# EAGLE design LoloTone - EuroRack - Power Supply Lunch Box V3 (EAGLE 7.1.0)
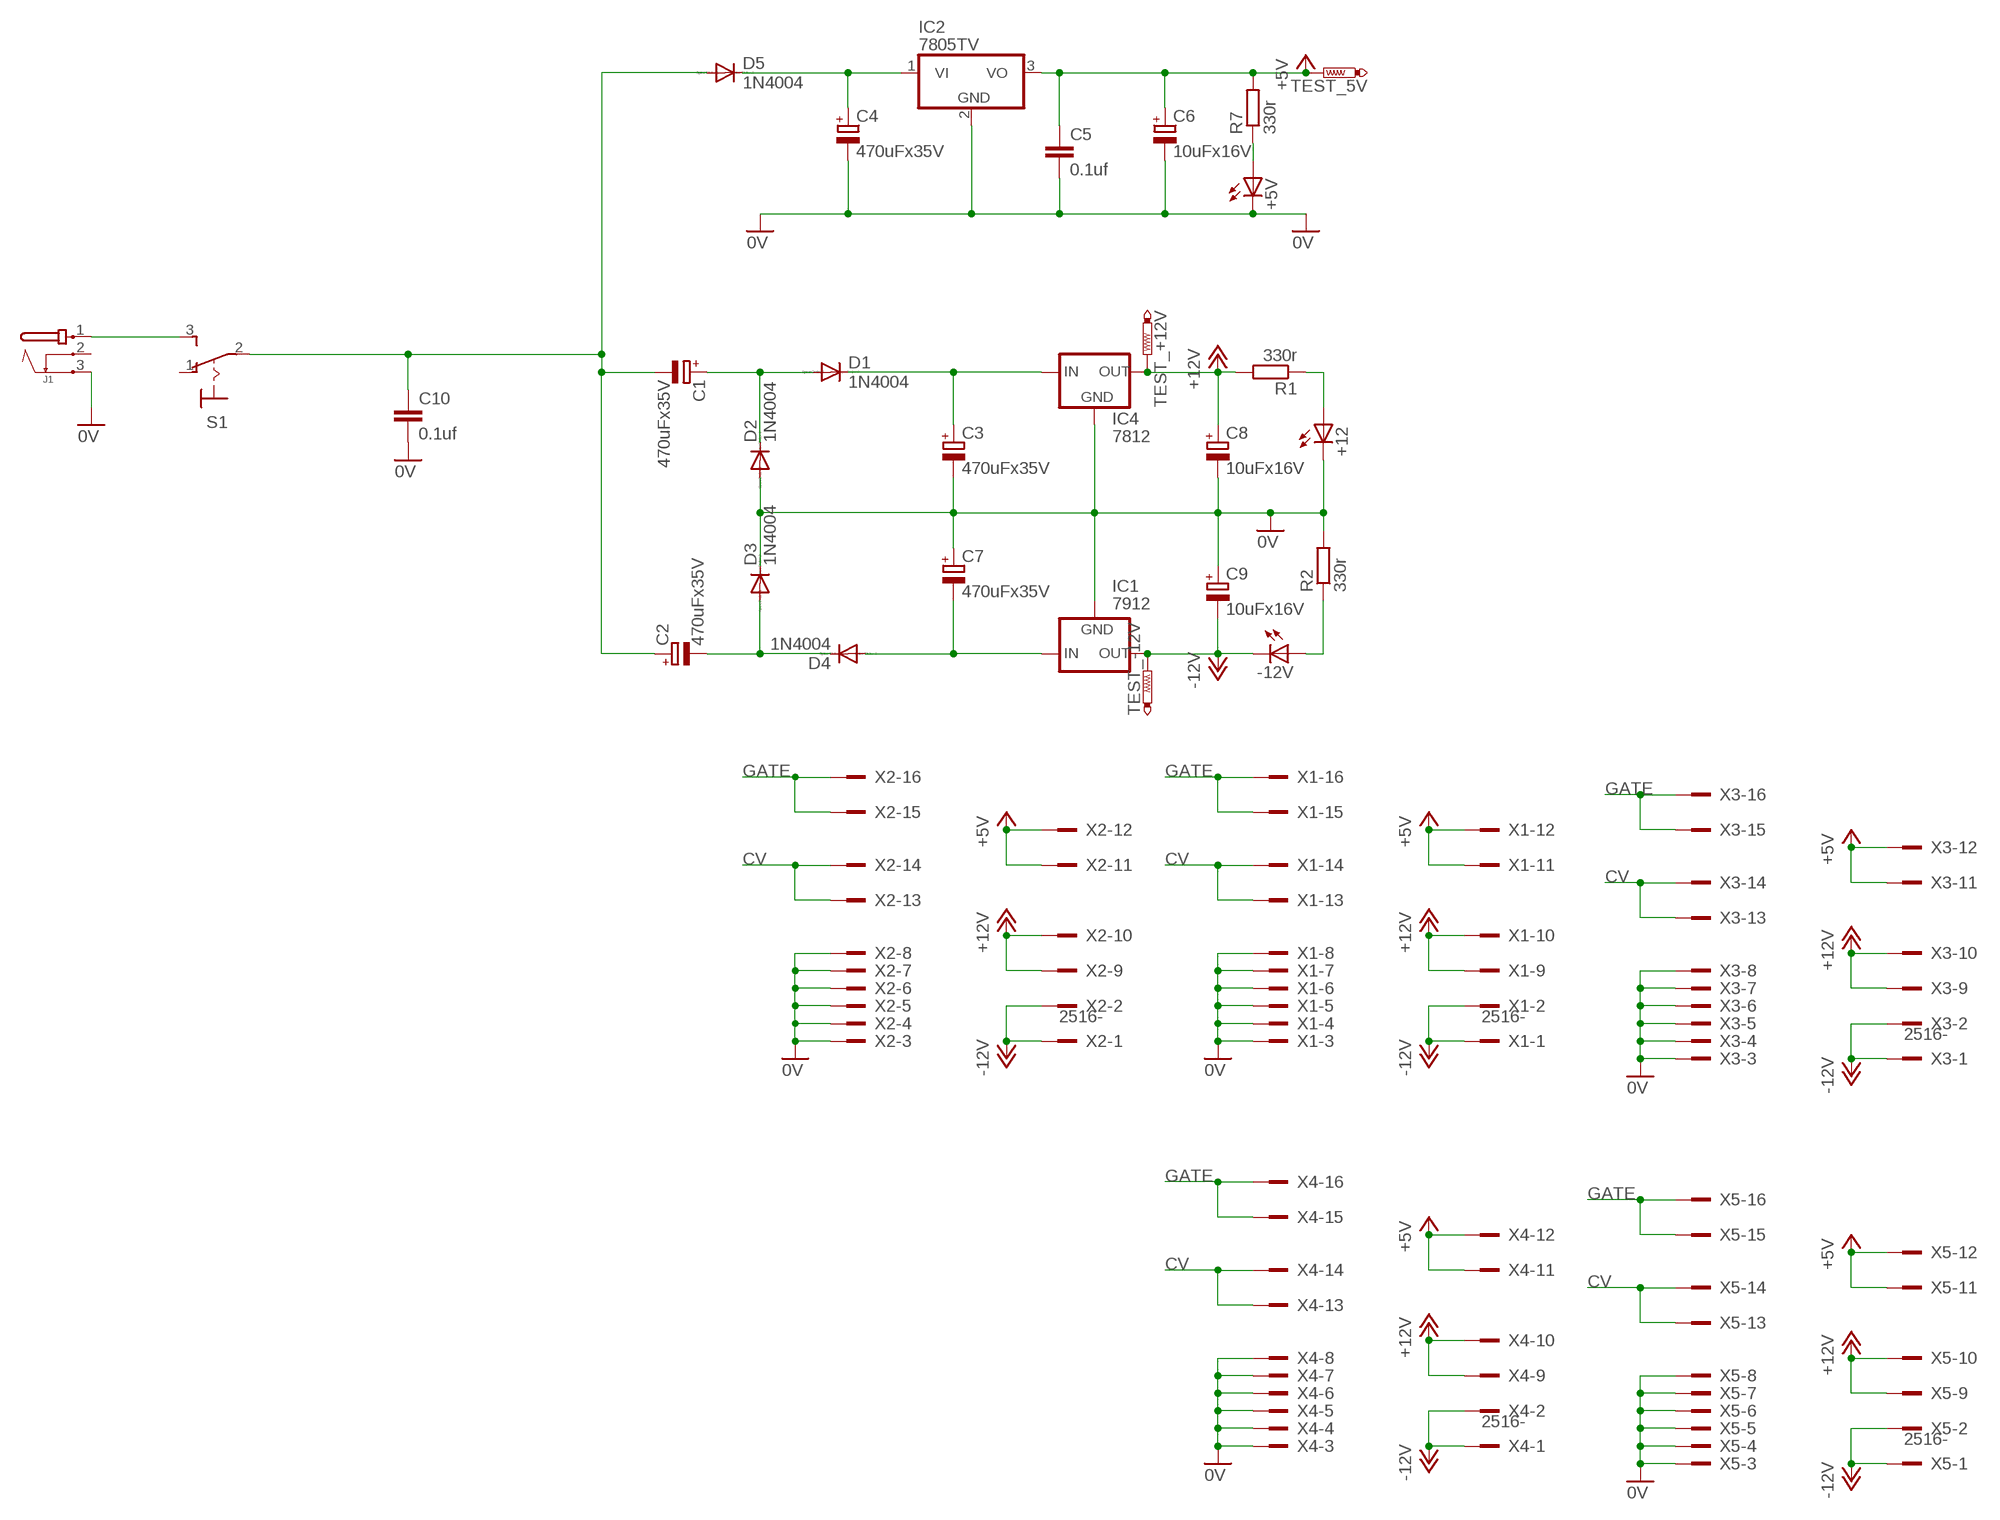
[diagram p0: schematic, sheet 1]

## Parts
+5V  LED5MM  [LED5MM]
+12  LED5MM  [LED5MM]
-12V  LED5MM  [LED5MM]
C1  470uFx35V  CPOL-EUE5-10.5  [E5-10,5]
C2  470uFx35V  CPOL-EUE5-10.5  [E5-10,5]
C3  470uFx35V  CPOL-EUE5-10.5  [E5-10,5]
C4  470uFx35V  CPOL-EUE5-10.5  [E5-10,5]
C5  0.1uf  C-EU025-025X050  [C025-025X050]
C6  10uFx16V  CPOL-EUE2,5-6E  [E2,5-6E]
C7  470uFx35V  CPOL-EUE5-10.5  [E5-10,5]
C8  10uFx16V  CPOL-EUE2,5-6E  [E2,5-6E]
C9  10uFx16V  CPOL-EUE2,5-6E  [E2,5-6E]
C10  0.1uf  C-EU075-032X103  [C075-032X103]
D1  1N4004  [DO41-10]
D2  1N4004  [DO41-10]
D3  1N4004  [DO41-10]
D4  1N4004  [DO41-10]
D5  1N4004  [DO41-10]
IC1  7912  79XXS  [79XXS]
IC2  7805TV  [TO220V]
IC4  7812  78XXS  [78XXS]
J1  JACK-PMS  [JACK-PMS]
R1  330r  R-EU_0207/10  [0207/10]
R2  330r  R-EU_0207/10  [0207/10]
R7  330r  R-EU_0207/10  [0207/10]
S1  320-916  [320-916]
TEST_5V  PTR1PAD1-13Y  [P1-13Y]
TEST_+12V  PTR1PAD1-13Y  [P1-13Y]
TEST_-12V  PTR1PAD1-13Y  [P1-13Y]
X1  2516-  [PAK100/2500-16]
X2  2516-  [PAK100/2500-16]
X3  2516-  [PAK100/2500-16]
X4  2516-  [PAK100/2500-16]
X5  2516-  [PAK100/2500-16]

## Nets
0V: +5V.K(C) +12.K(C) C3.- C4.- C5.2 C6.- C7.+ C8.- C9.+ C10.2 D2.A D3.C IC1.GND IC2.2(GND) IC4.GND J1.3 R2.2 X1.3 X1.4 X1.5 X1.6 X1.7 X1.8 X2.3 X2.4 X2.5 X2.6 X2.7 X2.8 X3.3 X3.4 X3.5 X3.6 X3.7 X3.8 X4.3 X4.4 X4.5 X4.6 X4.7 X4.8 X5.3 X5.4 X5.5 X5.6 X5.7 X5.8
+5V: C5.1 C6.+ IC2.3(VO) R7.2 TEST_5V.TP X1.11 X1.12 X2.11 X2.12 X3.11 X3.12 X4.11 X4.12 X5.11 X5.12
+12V: C8.+ IC4.OUT R1.2 TEST_+12V.TP X1.9 X1.10 X2.9 X2.10 X3.9 X3.10 X4.9 X4.10 X5.9 X5.10
-12V: -12V.K(C) C9.- IC1.OUT TEST_-12V.TP X1.1 X1.2 X2.1 X2.2 X3.1 X3.2 X4.1 X4.2 X5.1 X5.2
CV: X1.13 X1.14 X2.13 X2.14 X3.13 X3.14 X4.13 X4.14 X5.13 X5.14
GATE: X1.15 X1.16 X2.15 X2.16 X3.15 X3.16 X4.15 X4.16 X5.15 X5.16
N$2: C1.+ D1.A D2.C
N$3: C1.- C2.+ C10.1 D5.A S1.2(P)
N$4: +5V.A R7.1
N$5: C2.- D3.A D4.C
N$9: J1.1 S1.3(S)
N$11: C7.- D4.A IC1.IN
N$14: C3.+ D1.C IC4.IN
N$15: +12.A R1.1
N$17: -12V.A R2.1
N$19: C4.+ D5.C IC2.1(VI)
Unconnected: J1.2 S1.1(O)

## Library data of the parts
+5V +12 -12V = led:LED: LED OSRAM: - CHIPLED LG R971, LG N971, LY N971, LG Q971, LY Q971, LO R971, LY R971 LH N974, LH R974 LS Q976, LO Q976, LY Q976 LO Q996 - Hyper CHIPLED LW Q18S LB Q993, LB Q99A, LB R99A - SideLED LS A670, LO A670, LY A670, LG A670, LP A670 LB A673, LV A673, LT A673, LW A673 LH A674 LY A675 LS A676, LA A676, LO A676, LY A676, LW A676 LS A679, LY A679, LG A679 - Hyper Micro SIDELED® LS Y876, LA Y876, LO Y876, LY Y876 LT Y87S - SmartLED LW L88C, LW L88S LB L89C, LB L89S, LG L890 LS L89K, LO L89K, LY L89K LS L896, LA L896, LO L896, LY L896 - TOPLED LS T670, LO T670, LY T670, LG T670, LP T670 LSG T670, LSP T670, LSY T670, LOP T670, LYG T670 LG T671, LOG T671, LSG T671 LB T673, LV T673, LT T673, LW T673 LH T674 LS T676, LA T676, LO T676, LY T676, LB T676, LH T676, LSB T676, LW T676 LB T67C, LV T67C, LT T67C, LS T67K, LO T67K, LY T67K, LW E67C LS E67B, LA E67B, LO E67B, LY E67B, LB E67C, LV E67C, LT E67C LW T67C LS T679, LY T679, LG T679 LS T770, LO T770, LY T770, LG T770, LP T770 LB T773, LV T773, LT T773, LW T773 LH T774 LS E675, LA E675, LY E675, LS T675 LS T776, LA T776, LO T776, LY T776, LB T776 LHGB T686 LT T68C, LB T68C - Hyper Mini TOPLED® LB M676 - Mini TOPLED Santana® LG M470 LS M47K, LO M47K, LY M47K Source: http://www.osram.convergy.de LUXEON: - LUMILED® LXK2-PW12-R00, LXK2-PW12-S00, LXK2-PW14-U00, LXK2-PW14-V00 LXK2-PM12-R00, LXK2-PM12-S00, LXK2-PM14-U00 LXK2-PE12-Q00, LXK2-PE12-R00, LXK2-PE12-S00, LXK2-PE14-T00, LXK2-PE14-U00 LXK2-PB12-K00, LXK2-PB12-L00, LXK2-PB12-M00, LXK2-PB14-N00, LXK2-PB14-P00, LXK2-PB14-Q00 LXK2-PR12-L00, LXK2-PR12-M00, LXK2-PR14-Q00, LXK2-PR14-R00 LXK2-PD12-Q00, LXK2-PD12-R00, LXK2-PD12-S00 LXK2-PH12-R00, LXK2-PH12-S00 LXK2-PL12-P00, LXK2-PL12-Q00, LXK2-PL12-R00 Source: www.luxeon.com KINGBRIGHT: KA-3528ASYC Source: www.kingbright.com
C1-C4 C6-C9 = rcl:CPOL-EU: POLARIZED CAPACITOR, European symbol
C5 C10 = rcl:C-EU: CAPACITOR, European symbol
D1-D5 = diode:1N4004: DIODE general purpose rectifier, 1 A
IC1 = v-reg:79XXS: VOLTAGE REGULATOR
IC2 = linear:78*: Positive VOLTAGE REGULATOR Source: http://cache.national.com/ds/LM/LM78L05.pdf http://www.fairchildsemi.com/ds/LM/LM7805.pdf
IC4 = v-reg:78XXS: VOLTAGE REGULATOR
J1 = Power-in:JACK-PMS
R1 R2 R7 = rcl:R-EU_: RESISTOR, European symbol
S1 = switch:320-916: TOGGLE SWITCH distributor RS Components
TEST_5V TEST_+12V TEST_-12V = testpad:PTR1: TEST PIN
X1-X5 = con-3m:2516-: 3M (TM) Pak 100 4-Wall Header Source: 3M; OC_FARNELL: unknown; OC_NEWARK: unknown

## Board
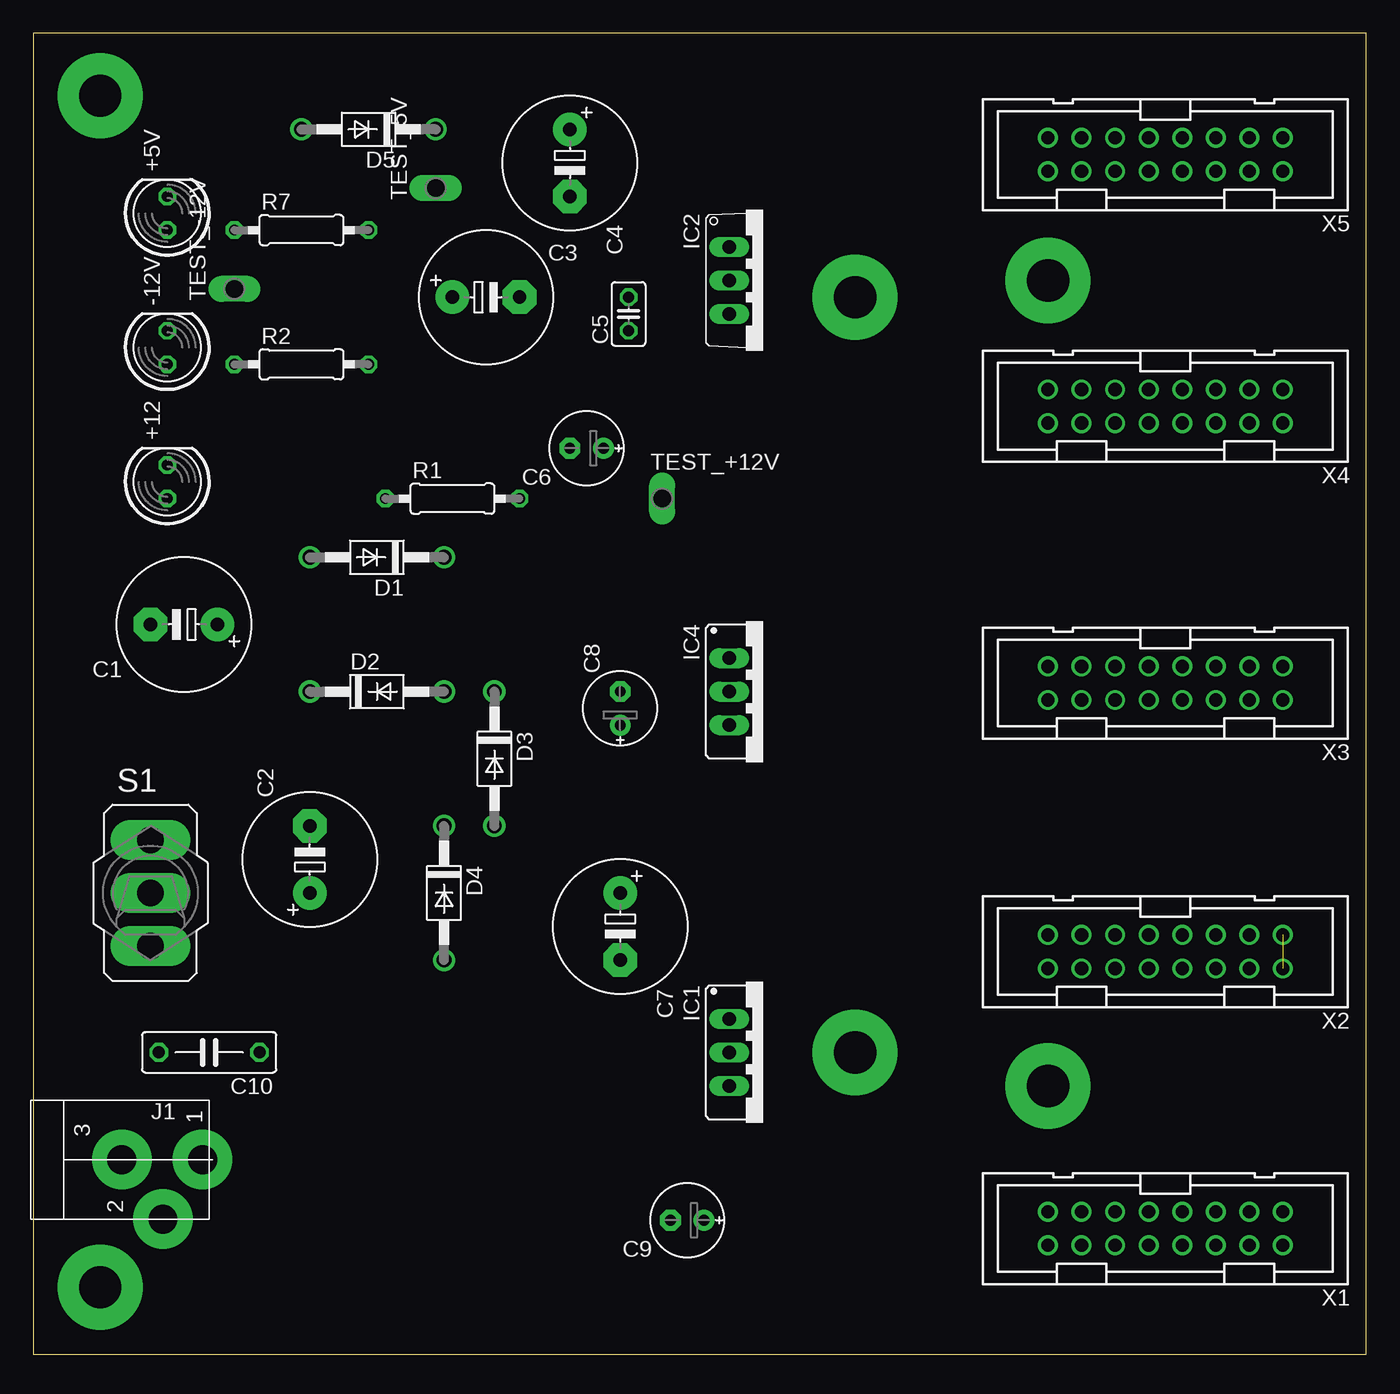
[diagram p1: board, top side]
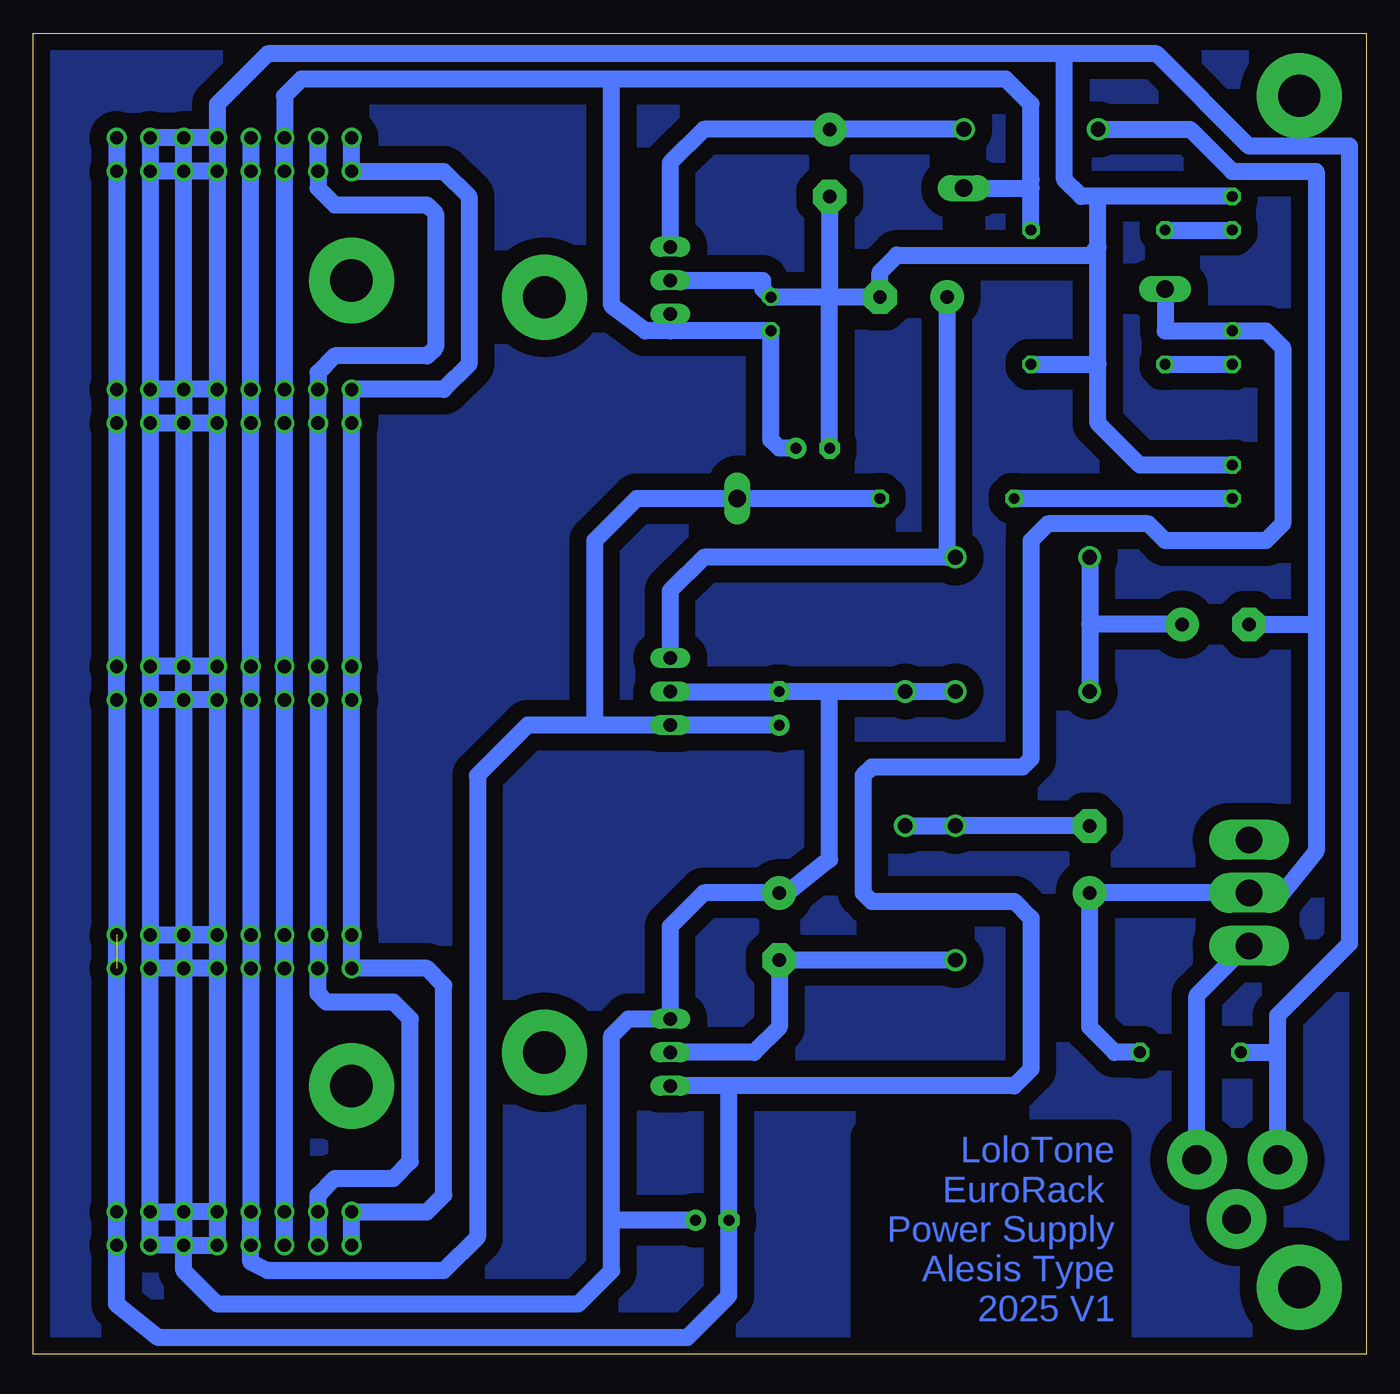
[diagram p2: board, bottom side, seen from below]

Size 100.94 x 100 mm. Coordinates in mm from the lower left corner, seen from the top.
Outline: 0,0 100.94,0 100.94,100 0,100 0,0
Copper layers (1*16): Top 0.035mm / dielectric 1.5mm / Bottom 0.035mm
Design rules "default *": minimum track width 10mil, minimum drill 24mil, track to track 8mil, track to pad 8mil, pad to pad 8mil, via to via 8mil, smd to smd 8mil, copper to edge 40mil, drill to drill 8mil, minimum pad ring 10mil, minimum via ring 8mil, stop-mask expansion 4mil, vias tented up to drill 0mil, thermal gap 10mil

### Footprints (pad centres in the part's own frame; a part is rotated, then mirrored left to right if it is on the bottom)
LED5MM = drill 0.813 octagon: A -1.27,0; K 1.27,0
E5-10,5 = drill 1.016 pad 2.54: + -2.54,0 | drill 1.016 pad 2.54 octagon: - 2.54,0
C025-025X050 = drill 0.813 octagon: 1 -1.27,0; 2 1.27,0
E2,5-6E = drill 0.813 pad 1.575: + -1.27,0 | drill 0.813 pad 1.575 octagon: - 1.27,0
C075-032X103 = drill 0.914 octagon: 1 -3.81,0; 2 3.81,0
DO41-10 = drill 1.118: A 5.08,0; C -5.08,0
79XXS = drill 1.016 long: GND -2.54,-2.54; IN 0,-2.54; OUT 2.54,-2.54
TO220V = drill 1.016 long: 1 -2.54,-2.54; 2 0,-2.54; 3 2.54,-2.54
78XXS = drill 1.016 long: GND 0,-2.54; IN -2.54,-2.54; OUT 2.54,-2.54
JACK-PMS = drill 2.184 pad 4.5: 1 -0.5,-3.31; 2 -5,-0.31; 3 -0.5,2.809
0207/10 = drill 0.813 octagon: 1 -5.08,0; 2 5.08,0
320-916 = drill 2.007 long: 1 0,4.013; 2 0,0; 3 0,-4.013
P1-13Y = drill 1.321 pad 1.905 long: TP 0,0
PAK100/2500-16 = drill 1 pad 1.422: 1 -8.89,-1.27; 2 -8.89,1.27; 3 -6.35,-1.27; 4 -6.35,1.27; 5 -3.81,-1.27; 6 -3.81,1.27; 7 -1.27,-1.27; 8 -1.27,1.27; 9 1.27,-1.27; 10 1.27,1.27; 11 3.81,-1.27; 12 3.81,1.27; 13 6.35,-1.27; 14 6.35,1.27; 15 8.89,-1.27; 16 8.89,1.27

### Placement (x,y rotation side)
+5V  10.16,86.36 90 top
+12  10.16,66.04 90 top
-12V  10.16,76.2 90 top
C1  11.43,55.24 180 top
C2  20.95,37.47 90 top
C3  34.29,80.01 0 top
C4  40.64,90.17 270 top
C5  45.09,78.74 90 top
C6  41.91,68.58 180 top
C7  44.45,32.38 270 top
C8  44.45,48.9 90 top
C9  49.53,10.16 180 top
C10  13.34,22.86 180 top
D1  26.04,60.33 180 top
D2  26.04,50.16 0 top
D3  34.92,45.09 270 top
D4  31.11,34.92 270 top
D5  25.4,92.71 180 top
IC1  55.24,22.86 270 top
IC2  55.24,81.28 270 top
IC4  55.24,50.16 270 top
J1  9.53,15.24 90 top
R1  31.75,64.77 0 top
R2  20.32,74.93 0 top
R7  20.32,85.09 0 top
S1  8.89,34.92 0 top
TEST_5V  30.48,88.27 90 top
TEST_+12V  47.62,64.77 0 top
TEST_-12V  15.24,80.64 90 top
X1  85.72,9.53 180 top
X2  85.72,30.48 180 top
X3  85.72,50.8 180 top
X4  85.72,71.75 180 top
X5  85.72,90.81 180 top

### Tracks (layer width: path | path; a pad name or v marks a point on that pad's centre or on a via)
0V
  Bottom 1.27: X2.8 X1.7 | X1.7 X1.8 X1.6 | X1.7 X1.5 | X1.3 X1.4 X1.6 | X1.3 X2.4 | X2.4 X2.3 X2.7 X2.5 | X2.5 X2.6 | X1.3 X1.5 | X3.8 X2.8 | X2.5 X3.6 X3.5 X4.6 X4.5 X5.6 X5.5 | X3.4 X2.4 | X3.3 X3.4 | X3.7 X3.8 | X4.8 X3.7 | X4.8 X4.7 | X5.8 X4.7 | X5.7 X5.8 | X5.4 X4.3 | X4.3 X4.4 | X4.4 X3.3 | X5.7 X5.3 X5.4 | X5.8 X5.4 | X4.7 X4.3 | X4.8 X4.4 | X3.7 X3.3 | X3.8 X3.4 | X2.8 X2.6 | X2.6 X2.4 | X2.6 X1.5 | X1.5 X1.6 | IC4.GND C8.- 40.64,50.16 | D2.A D3.C 40.64,50.16 | 40.64,50.16 40.64,37.47 43.81,34.92 C7.+ 50.16,34.92 52.7,32.38 IC1.GND 55.88,25.4 57.15,24.13 57.15,10.16 | X1.6 89.53,6.35 87,3.81 59.69,3.81 57.15,6.35 57.15,10.16 | 40.64,80.01 C3.- 36.83,81.92 35.56,83.19 20.95,83.19 20.32,83.82 | 40.64,80.01 C5.2 45.72,80.64 45.72,81.28 IC2.2 | C4.- 40.64,80.01 | C6.- 40.64,80.01 | 20.32,83.82 20.32,87.63 | R2.2 20.32,74.93 | 20.32,74.93 20.32,83.82 | +12.K 17.14,67.31 20.32,70.48 20.32,74.93 | C9.+ 57.15,10.16 | J1.3 6.72,22.86 | 6.72,22.86 6.72,25.67 1.27,31.11 1.27,91.44 8.89,91.44 15.88,98.42 22.86,98.42 | 22.86,98.42 83.19,98.42 87,94.61 X5.7 | C10.2 6.72,22.86 | +5V.K 20.32,87.63 | 20.32,87.63 21.59,87.63 22.86,88.9 22.86,98.42
+5V
  Bottom 1.27: X1.12 X1.11 X2.12 X2.11 X3.12 X3.11 X4.12 X4.11 X5.12 X5.11 81.92,95.25 80.64,96.52 57.15,96.52 | 52.7,77.47 C5.1 45.09,69.22 44.45,68.58 C6.+ | 52.7,77.47 IC2.3 | 52.7,77.47 54.61,77.47 57.15,79.38 57.15,96.52 | R7.2 25.4,88.27 | 57.15,96.52 27.3,96.52 25.4,94.61 25.4,88.9 25.4,88.27 | TEST_5V.TP 25.4,88.27
+12V
  Bottom 1.27: X5.9 X5.10 X4.9 X4.10 X3.9 X3.10 X2.9 X2.10 X1.9 X1.10 84.45,6.99 83.19,6.35 69.85,6.35 67.31,8.89 67.31,43.81 63.5,47.62 58.42,47.62 | C8.+ IC4.OUT 58.42,47.62 | R1.2 TEST_+12V.TP 48.26,64.77 55.24,64.77 58.42,61.59 58.42,47.62
-12V  (1 unrouted)
  Bottom 1.27: X5.1 X5.2 X4.1 X4.2 X3.1 X3.2 X2.1 X1.1 X1.2 94.61,3.81 91.44,1.27 51.44,1.27 48.26,4.45 C9.- 48.26,20.32 | 48.26,20.32 26.67,20.32 25.4,21.59 25.4,33.02 26.67,34.29 37.47,34.29 38.1,34.92 38.1,43.81 37.47,44.45 26.04,44.45 25.4,45.09 25.4,61.59 24.13,62.87 16.51,62.87 15.24,61.59 7.62,61.59 6.35,62.87 6.35,76.2 7.62,77.47 -12V.K 15.24,77.47 TEST_-12V.TP | 48.26,20.32 IC1.OUT
CV
  Bottom 1.27: X1.14 X1.13 79.38,12.06 78.11,13.34 73.66,13.34 72.39,14.61 72.39,25.4 73.66,26.67 78.74,26.67 79.38,27.3 X2.14 X2.13 X3.14 X3.13 X4.14 X4.13 79.38,74.3 78.11,75.56 71.12,75.56 70.48,76.2 70.48,86.36 71.12,87 78.11,87 79.38,88.27 X5.14 X5.13
GATE
  Bottom 1.27: X1.16 X1.15 71.12,10.79 69.85,12.06 69.85,27.94 71.12,29.21 X2.16 X2.15 X3.16 X3.15 X4.16 X4.15 69.85,73.03 67.94,74.93 67.94,87.63 69.85,89.53 X5.16 X5.15
N$1  (via drill 3.2 pad 6.45)
  other vias: 76.83,81.28
N$2
  Bottom 1.27: D1.A 20.95,55.24 | 20.95,55.24 D2.C | C1.+ 20.95,55.24
N$3
  Bottom 1.27: D5.A 13.34,92.71 10.16,89.53 3.81,89.53 3.81,55.24 | C1.- 3.81,55.24 | 3.81,55.24 3.81,38.1 6.35,34.92 S1.2 C2.+ 20.95,24.77 19.05,22.86 C10.1
N$4
  Bottom 1.27: R7.1 +5V.A
N$5
  Bottom 1.27: C2.- D4.C D3.A
N$6  (via drill 3.2 pad 6.45)
  other vias: 5.08,5.08
N$8  (via drill 3.2 pad 6.45)
  other vias: 5.08,95.25
N$9
  Bottom 1.27: J1.1 12.84,27.17 8.89,31.11 S1.3
N$10  (via drill 3.2 pad 6.45)
  other vias: 76.83,20.32
N$11
  Bottom 1.27: D4.A C7.- 44.45,24.77 46.35,22.86 IC1.IN
N$12
  pour Bottom (isolate 1.27): 0,0 0,99.69 0.64,99.69 100.97,99.69 100.97,0
N$13  (via drill 3.2 pad 6.45)
  other vias: 62.23,22.86
N$14
  Bottom 1.27: D1.C 31.75,60.33 | 31.75,60.33 50.16,60.33 52.7,57.78 IC4.IN | C3.+ 31.75,60.33
N$15
  Bottom 1.27: +12.A R1.1
N$16  (via drill 3.2 pad 6.45)
  other vias: 62.23,80.01
N$17
  Bottom 1.27: R2.1 -12V.A
N$19
  Bottom 1.27: IC2.1 52.7,90.17 50.16,92.71 C4.+ D5.C

### Text on the board
Bottom: LoloTone / EuroRack / Power Supply / Alesis Type / 2025 V1